# Altium schematic sheet Main.SchDoc
size B; SheetNumber: 1; SheetTotal: 2
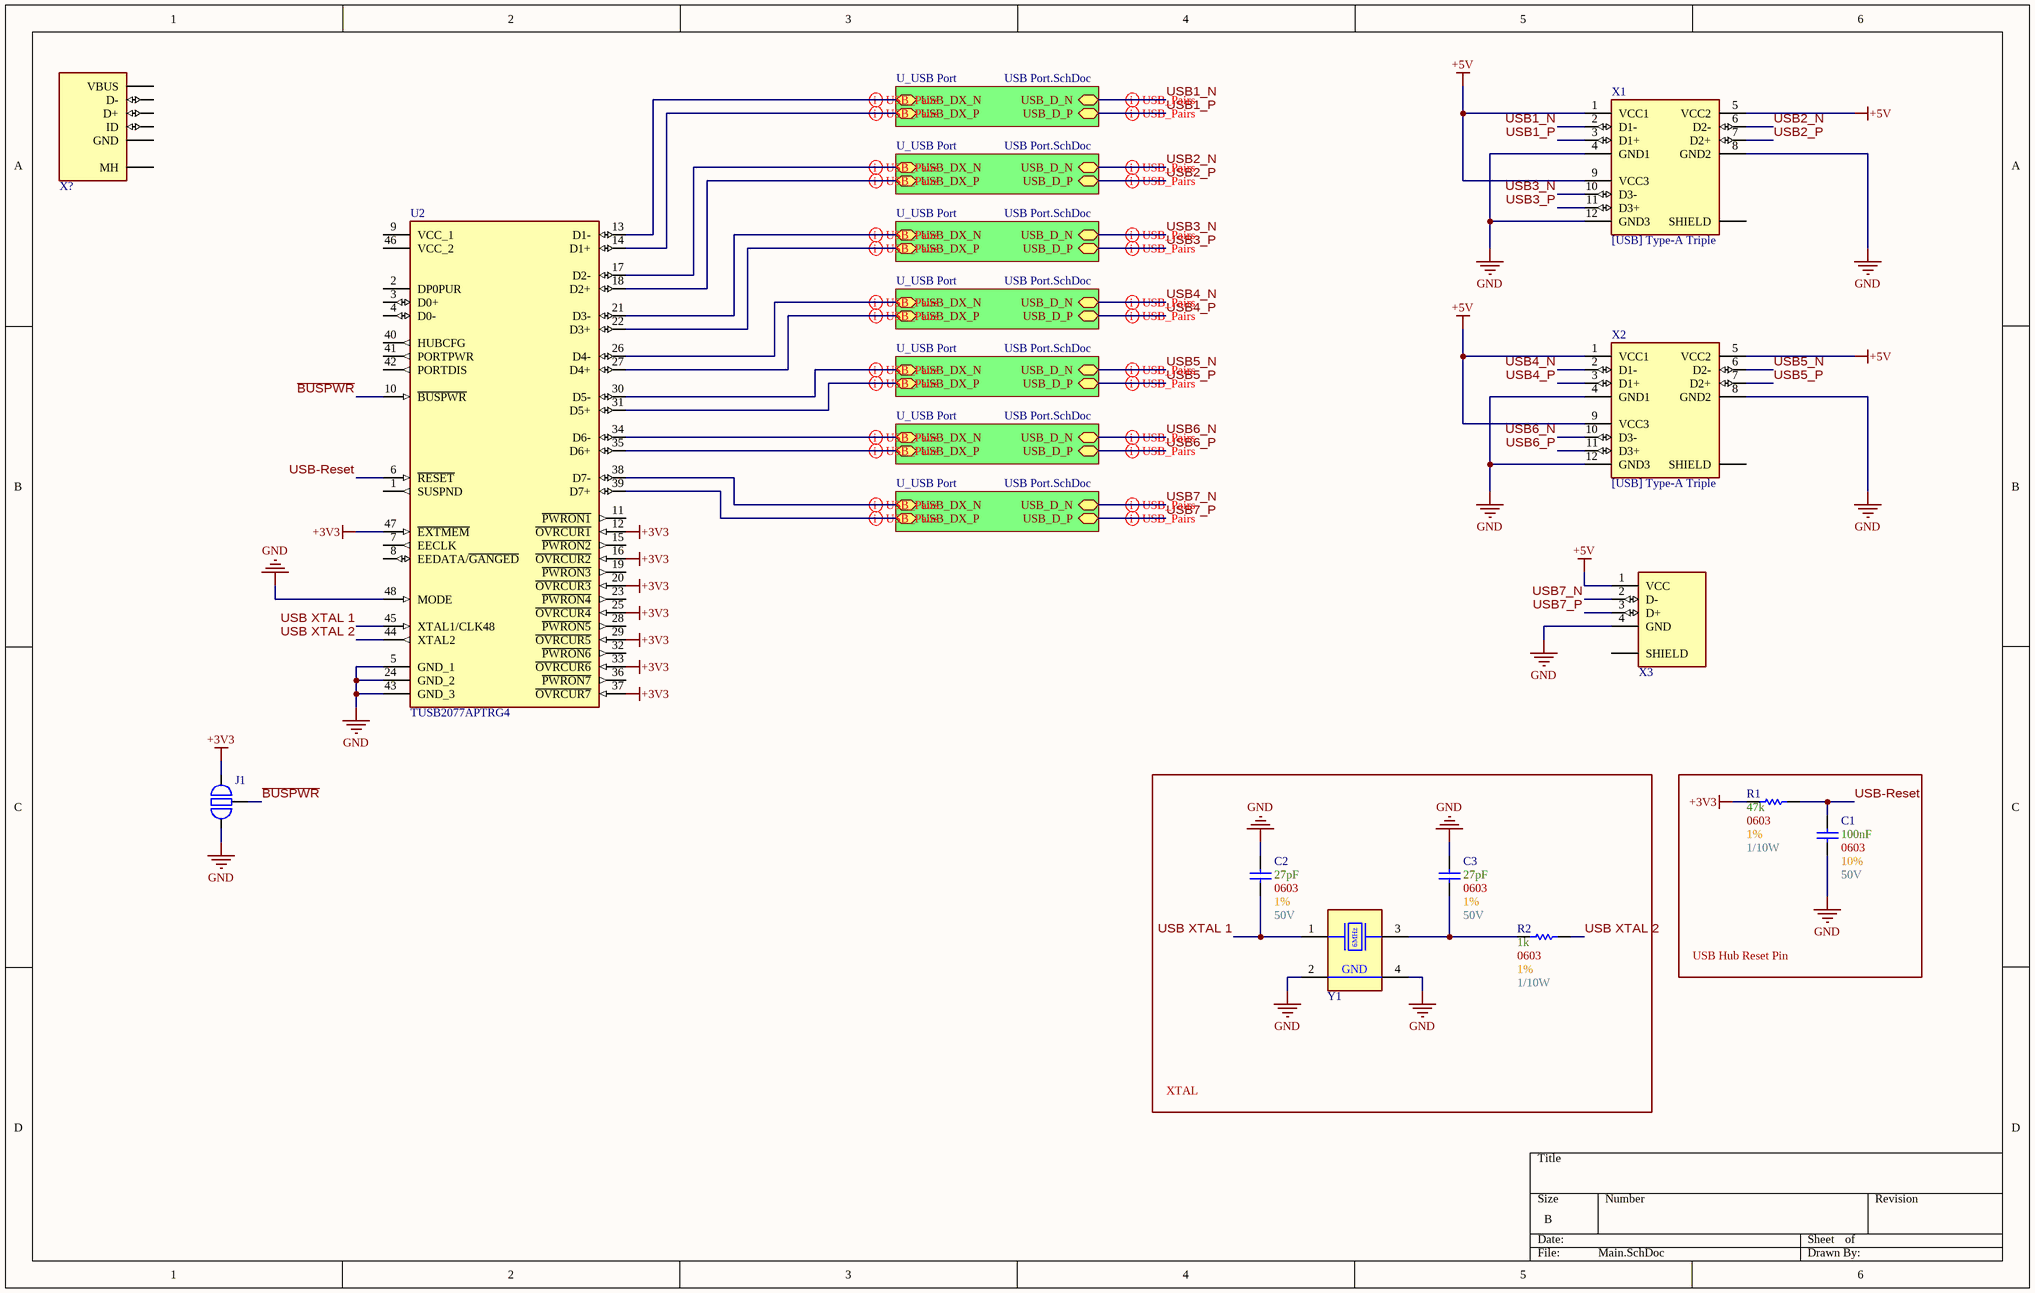
[diagram p0: Main.SchDoc]

## Parts
C1  Max Voltage: 50V  Size Package: 0603  Tolerance: 10%  Capacitance: 100nF  [[Cap] SMD 0603]  (hidden comment: [Cap] 0603 0.1uF 10% 50V)
C2  Max Voltage: 50V  Size Package: 0603  Tolerance: 1%  Capacitance: 27pF  [[Cap] SMD 0603]  (hidden comment: [Cap] 0603 27pF 1% 50V)
C3  Max Voltage: 50V  Size Package: 0603  Tolerance: 1%  Capacitance: 27pF  [[Cap] SMD 0603]  (hidden comment: [Cap] 0603 27pF 1% 50V)
J1  [Jumper] Thru-Hole 3pin  [[Jumper] Thru-Hole 3pin]  (value not drawn)  (no BOM)
R1  Wattage: 1/10W  Tolerance: 1%  Resistance: 47k  Size Package: 0603  [[Res] SMD 0603]  (hidden comment: [47k] SMD 0603 1% 1/10W)
R2  Wattage: 1/10W  Tolerance: 1%  Resistance: 1k  Size Package: 0603  [[Res] SMD 0603]  (hidden comment: [1k] SMD 0603 1% 1/10W)
U2  TUSB2077APTRG4  [48-LQFP (7x7)]
X1  [USB] Type-A Triple  [[USB] Type-A Triple]
X2  [USB] Type-A Triple  [[USB] Type-A Triple]
X3  USB-A  [[USB] Type-A]  (value not drawn)
X?  [USB] Type-B Mini  [[USB] Type-B Mini]  (value not drawn)
Y1  [Crystal] SMD 6MHz  [[Crystal] SMD 6MHz]  (value not drawn)

## Blocks framed on the sheet
XTAL: C2 C3 R2 Y1
USB Hub Reset Pin: C1 R1

## Sub-sheets
U_USB Port = USB Port.SchDoc: USB_DX_P (bidir), USB_DX_N (bidir), USB_D_P (bidir), USB_D_N (bidir)
U_USB Port = USB Port.SchDoc: USB_DX_P (bidir), USB_DX_N (bidir), USB_D_P (bidir), USB_D_N (bidir)
U_USB Port = USB Port.SchDoc: USB_DX_P (bidir), USB_DX_N (bidir), USB_D_P (bidir), USB_D_N (bidir)
U_USB Port = USB Port.SchDoc: USB_DX_P (bidir), USB_DX_N (bidir), USB_D_P (bidir), USB_D_N (bidir)
U_USB Port = USB Port.SchDoc: USB_DX_P (bidir), USB_DX_N (bidir), USB_D_P (bidir), USB_D_N (bidir)
U_USB Port = USB Port.SchDoc: USB_DX_P (bidir), USB_DX_N (bidir), USB_D_P (bidir), USB_D_N (bidir)
U_USB Port = USB Port.SchDoc: USB_DX_P (bidir), USB_DX_N (bidir), USB_D_P (bidir), USB_D_N (bidir)

## Nets
+3V3: J1.1 R1.1 U2.12(~{OVRCUR1}) U2.16(~{OVRCUR2}) U2.20(~{OVRCUR3}) U2.25(~{OVRCUR4}) U2.29(~{OVRCUR5}) U2.33(~{OVRCUR6}) U2.37(~{OVRCUR7}) U2.47(~{EXTMEM})
+5V: X1.1(VCC1) X1.5(VCC2) X1.9(VCC3) X2.1(VCC1) X2.5(VCC2) X2.9(VCC3) X3.1(VCC)
GND: C1.1 C2.1 C3.1 J1.3 U2.5(GND_1) U2.24(GND_2) U2.43(GND_3) U2.48(MODE) X1.4(GND1) X1.8(GND2) X1.12(GND3) X2.4(GND1) X2.8(GND2) X2.12(GND3) X3.4(GND) Y1.2(GND) Y1.4(GND)
~{BUSPWR}: J1.2(Common) U2.10(~{BUSPWR})
USB1_N: X1.2(D1-) ; sheet U_USB Port/USB_D_N
USB1_P: X1.3(D1+) ; sheet U_USB Port/USB_D_P
USB2_N: X1.6(D2-) ; sheet U_USB Port/USB_D_N
USB2_P: X1.7(D2+) ; sheet U_USB Port/USB_D_P
USB3_N: X1.10(D3-) ; sheet U_USB Port/USB_D_N
USB3_P: X1.11(D3+) ; sheet U_USB Port/USB_D_P
USB4_N: X2.2(D1-) ; sheet U_USB Port/USB_D_N
USB4_P: X2.3(D1+) ; sheet U_USB Port/USB_D_P
USB5_N: X2.6(D2-) ; sheet U_USB Port/USB_D_N
USB5_P: X2.7(D2+) ; sheet U_USB Port/USB_D_P
USB6_N: X2.10(D3-) ; sheet U_USB Port/USB_D_N
USB6_P: X2.11(D3+) ; sheet U_USB Port/USB_D_P
USB7_N: X3.2(D-) ; sheet U_USB Port/USB_D_N
USB7_P: X3.3(D+) ; sheet U_USB Port/USB_D_P
USB XTAL 1: C2.2 U2.45(XTAL1/CLK48) Y1.1(XTAL1)
USB XTAL 2: R2.2 U2.44(XTAL2)
USB-Reset: C1.2 R1.2 U2.6(~{RESET})
NetC3_2: C3.2 R2.1 Y1.3(XTAL2)
NetU2_13: U2.13(D1-) ; sheet U_USB Port/USB_DX_N
NetU2_14: U2.14(D1+) ; sheet U_USB Port/USB_DX_P
NetU2_17: U2.17(D2-) ; sheet U_USB Port/USB_DX_N
NetU2_18: U2.18(D2+) ; sheet U_USB Port/USB_DX_P
NetU2_21: U2.21(D3-) ; sheet U_USB Port/USB_DX_N
NetU2_22: U2.22(D3+) ; sheet U_USB Port/USB_DX_P
NetU2_26: U2.26(D4-) ; sheet U_USB Port/USB_DX_N
NetU2_27: U2.27(D4+) ; sheet U_USB Port/USB_DX_P
NetU2_30: U2.30(D5-) ; sheet U_USB Port/USB_DX_N
NetU2_31: U2.31(D5+) ; sheet U_USB Port/USB_DX_P
NetU2_34: U2.34(D6-) ; sheet U_USB Port/USB_DX_N
NetU2_35: U2.35(D6+) ; sheet U_USB Port/USB_DX_P
NetU2_38: U2.38(D7-) ; sheet U_USB Port/USB_DX_N
NetU2_39: U2.39(D7+) ; sheet U_USB Port/USB_DX_P

Not connected (* = marked no-connect by the designer): U2 1(SUSPND) 2(DP0PUR) 3(D0+) 4(D0-) 7(EECLK) 8(EEDATA/~{GANGED}) 9(VCC_1) 11(~{PWRON1}) 15(~{PWRON2}) 19(~{PWRON3}) 23(~{PWRON4}) 28(~{PWRON5}) 32(~{PWRON6}) 36(~{PWRON7}) 40(HUBCFG) 41(PORTPWR) 42(PORTDIS) 46(VCC_2); X1 MH(SHIELD); X2 MH(SHIELD); X3 MH(SHIELD); X? 1(VBUS) 2(D-) 3(D+) 4(ID) 5(GND) MH

## Layout directives
differential pair; differential pair class USB_Pairs: NetU2_13, NetU2_14, NetU2_17, NetU2_18, NetU2_21, NetU2_22, NetU2_26, NetU2_27, NetU2_30, NetU2_31, NetU2_34, NetU2_35, NetU2_38, NetU2_39, USB1_N, USB1_P, USB2_N, USB2_P, USB3_N, USB3_P, USB4_N, USB4_P, USB5_N, USB5_P, USB6_N, USB6_P, USB7_N, USB7_P

## Notes on the sheet
- (in symbol [Crystal] SMD 6MHz) 6MHz

## Library data of the parts
C1 = [Cap] 0603 0.1uF 10% 50V: CL10B104KB8NNNC; Supplier 1: DigiKey; Supplier Part Number 1: 1276-1000-6-ND
C2 C3 = [Cap] 0603 27pF 1% 50V: 0603N270F500CT; Supplier 1: DigiKey; Supplier Part Number 1: 1292-1510-1-ND
R1 = [47k] SMD 0603 1% 1/10W: RC0603FR-0747KL; Supplier 1: DigiKey; Supplier Part Number 1: 311-47.0KHRDKR-ND
R2 = [1k] SMD 0603 1% 1/10W: RMCF0603FT1K00; Supplier 1: DigiKey; Supplier Part Number 1: RMCF0603FT1K00DKR-ND
U2 = [USB Hub] 2.0 7port: TUSB2077APTR; Supplier 1: DigiKey; Supplier Part Number 1: 296-37871-6-ND
X1 X2 = [USB] Type-A Triple: 1002-012-01020; Supplier 1: DigiKey; Supplier Part Number 1: 1175-1002-012-01020-ND
X3 = [USB] Type-A: KUSBEX-ASFS1N-B; Supplier 1: DigiKey; Supplier Part Number 1: 2092-KUSBEX-ASFS1N-B-ND
X? = [USB] Type-B Mini: MUSB-05-S-B-SM-A-K-TR; Supplier 1: DigiKey; Supplier Part Number 1: SAM14226CT-ND
Y1 = [Crystal] SMD 6MHz: ECS-060-18-20BM-JEN-TR; Supplier 1: DigiKey; Supplier Part Number 1: XC2349DKR-ND